# Altium schematic sheet Alimentacion.SchDoc: G.E.M.A.S
size A; Date: 01/10/2026; SheetNumber: 1; SheetTotal: 5
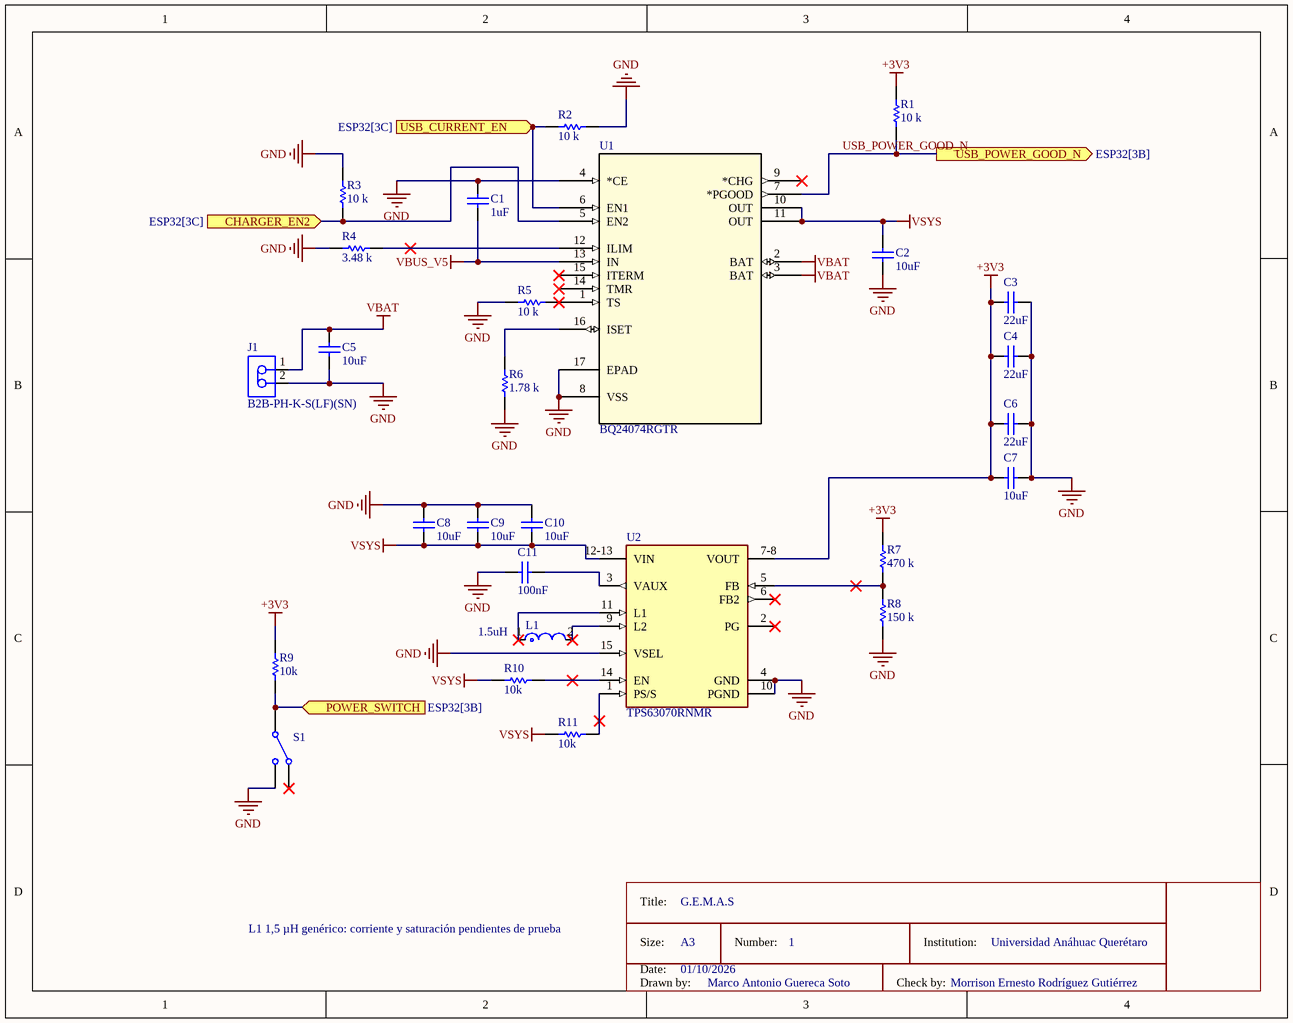
[diagram p0: Alimentacion.SchDoc]

## Parts
C1  value 1uF  [CAP 1206_3216]  (hidden comment: Capacitor)
C2  value 10uF  [CAP 1206_3216]  (hidden comment: Capacitor)
C3  22uF  [CAP 1206_3216]
C4  22uF  [CAP 1206_3216]
C5  value 10uF  [CAP 1206_3216]  (hidden comment: Capacitor)
C6  22uF  [CAP 1206_3216]
C7  value 10uF  [CAP 1206_3216]  (hidden comment: Capacitor)
C8  value 10uF  [CAP 1206_3216]  (hidden comment: Capacitor)
C9  value 10uF  [CAP 1206_3216]  (hidden comment: Capacitor)
C10  value 10uF  [CAP 1206_3216]  (hidden comment: Capacitor)
C11  value 100nF  [CAP 1206_3216]  (hidden comment: Capacitor)
J1  B2B-PH-K-S(LF)(SN)  [JST-B2B-PH-K-S_V]
L1  1.5uH  [FP-XFL4020-MFG]
R1  value 10 k  [RES 0805_2012]  (hidden comment: Resistor)
R2  value 10 k  [RES 0805_2012]  (hidden comment: Resistor)
R3  value 10 k  [RES 0805_2012]  (hidden comment: Resistor)
R4  value 3.48 k  [RES 0805_2012]  (hidden comment: Resistor)
R5  value 10 k  [RES 0805_2012]  (hidden comment: Resistor)
R6  value 1.78 k  [RES 0805_2012]  (hidden comment: Resistor)
R7  value 470 k  [RES 0805_2012]  (hidden comment: Resistor)
R8  value 150 k  [RES 0805_2012]  (hidden comment: Resistor)
R9  value 10k  [RES 0805_2012]  (hidden comment: Resistor)
R10  value 10k  [RES 0805_2012]  (hidden comment: Resistor)
R11  value 10k  [RES 0805_2012]  (hidden comment: Resistor)
S1  Single-Pole, Double-Throw Switch  [1P2T_SS-12D00_CNK]  (value not drawn)
U1  BQ24074RGTR  [RGT16_1P7X1P7]
U2  TPS63070RNMR  [FP-RNM0015A-MFG]

## Ports
CHARGER_EN2 (in, see ESP32[3C]), POWER_SWITCH (in, see ESP32[3B]), USB_CURRENT_EN (in, see ESP32[3C]), USB_POWER_GOOD_N (out, see ESP32[3B])

## Nets
+3V3: C3.1 C4.1 C6.1 C7.1 R1.1 R7.2 R9.1 U2.7-8(VOUT)
GND: C1.2 C2.1 C3.2 C4.2 C5.1 C6.2 C7.2 C8.1 C9.1 C10.1 C11.1 J1.2 R2.1 R3.1 R4.2 R5.2 R6.2 R8.2 S1.2 U1.4(*CE) U1.8(VSS) U1.17(EPAD) U2.4(GND) U2.10(PGND) U2.15(VSEL)
VBAT: C5.2 J1.1 U1.2(BAT) U1.3(BAT)
VBUS_V5: C1.1 U1.13(IN)
VSYS: C2.2 C8.2 C9.2 C10.2 R10.1 R11.1 U1.10(OUT) U1.11(OUT) U2.12-13(VIN)
CHARGER_EN2: R3.2 U1.5(EN2) ; port CHARGER_EN2
POWER_SWITCH: R9.2 S1.1 ; port POWER_SWITCH
USB_CURRENT_EN: R2.2 U1.6(EN1) ; port USB_CURRENT_EN
USB_POWER_GOOD_N: R1.2 U1.7(*PGOOD) ; port USB_POWER_GOOD_N
NetC11_2: C11.2 U2.3(VAUX)
NetL1_1: L1.1 U2.11(L1)
NetL1_2: L1.2 U2.9(L2)
NetR4_1: R4.1 U1.12(ILIM)
NetR5_1: R5.1 U1.1(TS)
NetR6_1: R6.1 U1.16(ISET)
NetR7_1: R7.1 R8.1 U2.5(FB)
NetR10_2: R10.2 U2.14(EN)
NetR11_2: R11.2 U2.1(PS/S)

Not connected (* = marked no-connect by the designer): S1 3*; U1 9(*CHG)* 14(TMR)* 15(ITERM)*; U2 2(PG)* 6(FB2)*

## Notes on the sheet
- L1 1,5 µH genérico: corriente y saturación pendientes de prueba
- Title:
- Date:
- Size:
- A3
- Number:
- Institution:
- Universidad Anáhuac Querétaro
- Drawn by:
- Marco Antonio Guereca Soto
- Check by:
- Morrison Ernesto Rodríguez Gutiérrez

## Library data of the parts
C1 C2 C5 C7-C11 = Capacitor: SimulationGenericComponent: True
C3 C4 C6 = Capacitor: 22F; SimulationGenericComponent: True; Value: 22uF
J1 = CMP-2000-05162-1: Male Header, Pitch 2 mm, 1 x 2 Position, Height 6 mm, Tail Length 3.4 mm, -25 to 85 degC, RoHS, Bulk; Manufacturer: JST; Pitch: 2mm; Style/Orientation: StraightHeader/Plug; No of Positions: 2; Datasheet Version: Nov-08; Datasheet URL: http://datasheet.octopart.com/B2B-PH-K-S%28LF%29%28SN%29-JST-datasheet-8324864.pdf; Manufacturer URL: http://www.jst.com/home2.html; Type: ShroudedHeader; Termination: Crimp
L1 = CMP-11268-000104-1: Inductor Power Shielded Wirewound 1.5uH 20% 100KHz 9.1A 15.8mOhm DCR 1515 Automotive Embossed Plastic T/R; Core Material: Composite; DC Resistance (DCR): 15.8mR; Saturation Current: 4.1A; Self Resonant Frequency: 59MHz; Tolerance: 20%; Inductance: 1.5uH; Max DC Current: 9.1A; RoHS Compliant: Yes; Max Operating Temperature: 125°C; Length: 4.3mm; Case/Package: SMD/SMT; Mount: Surface Mount; Shielding: Shielded; Min Operating Temperature: -40°C; RMS Current (Irms): 9.1A; Test Frequency: 100kHz; Inductance Tolerance: 20%; REACH SVHC: No SVHC; Packaging: Tape and Reel; Termination: SMD/SMT; Lead Free: Contains Lead; Width: 4.3mm; Series: XFL4020; Height: 2.1mm
R1-R11 = Resistor: TC1: 0; SimulationGenericComponent: True; TC2: 0
S1 = SPDT SW: nodeUP_closed: 1; Rclosed: 1m; Ropen: 1Meg; SimulationGenericComponent: True
U1 = BQ24074RGTR: Standalone 1-cell 1.5-A linear battery charger, Power Path, 4.2-V VBAT, 10.5-V OVP and 4.4-V VOUT 16-VQFN -40 to 85; Manufacturer_Name: Texas Instruments; Copyright: Copyright (C) 2026 Ultra Librarian. All rights reserved.; Manufacturer_Part_Number: BQ24074RGTR; RefDes: RefDes; Type: Type
U2 = CMP-04918-000409-1: IC REG BCK BST ADJ 3.6A 15VQFN; Synchronous Rectifier: Yes; Output Type: Adjustable; Output Current: 2A; Max Input Voltage: 16V; Switching Frequency: 2.4MHz; Min Output Voltage: 2.5V; Output Configuration: Positive; Min Input Voltage: 2V; Topology: Buck-Boost; Number of Outputs: 1; Max Output Voltage: 9V; Quiescent Current: 50uA; Max Operating Temperature: 125°C; Case/Package: VQFN; Number of Pins: 15; RoHS Compliant: Yes; Mount: Surface Mount; Min Operating Temperature: -40°C; Lead Free: Lead Free; Packaging: Tape and Reel